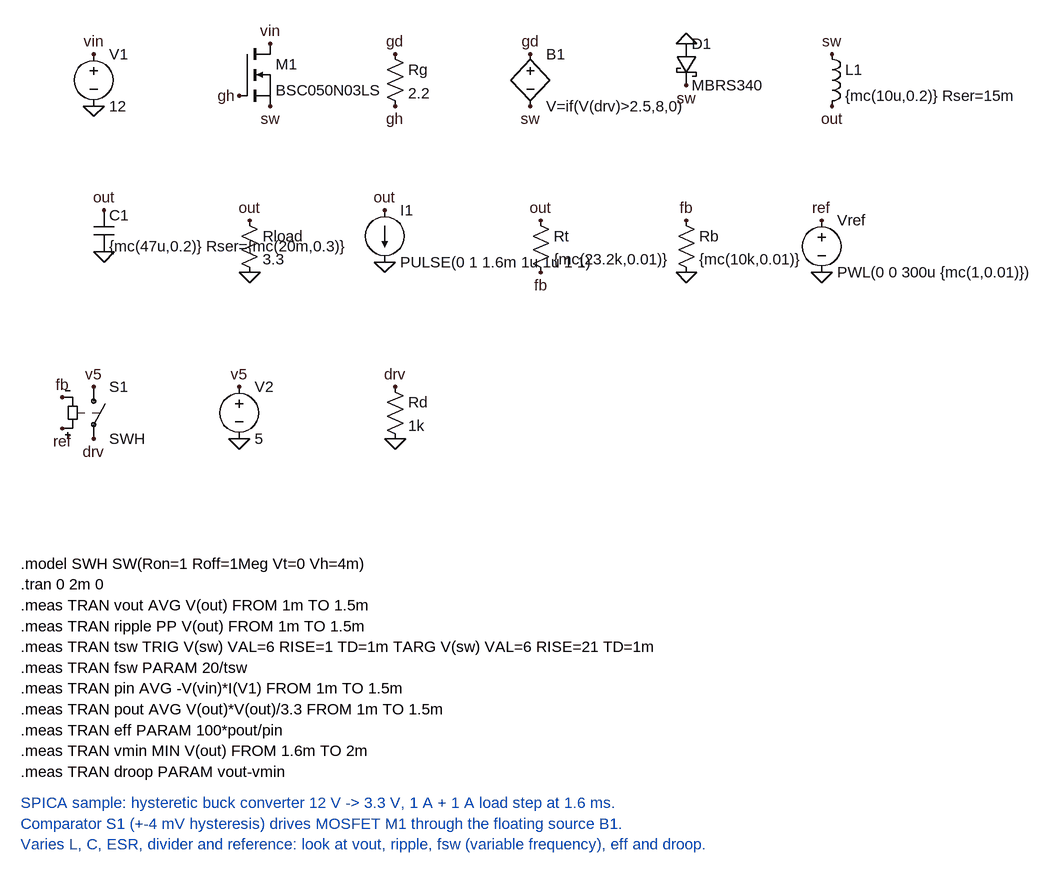
[diagram p0: schematic buck_hysteretic.asc]
buck_hysteretic.asc, the LTspice schematic file:
Version 4
SHEET 1 1600 1200
FLAG 144 80 vin
FLAG 144 160 0
FLAG 416 64 vin
FLAG 368 144 gh
FLAG 416 160 sw
FLAG 608 80 gd
FLAG 608 160 gh
FLAG 816 80 gd
FLAG 816 160 sw
FLAG 1056 64 0
FLAG 1056 128 sw
FLAG 1280 80 sw
FLAG 1280 160 out
FLAG 160 320 out
FLAG 160 384 0
FLAG 384 336 out
FLAG 384 416 0
FLAG 592 320 out
FLAG 592 400 0
FLAG 832 336 out
FLAG 832 416 fb
FLAG 1056 336 fb
FLAG 1056 416 0
FLAG 1264 336 ref
FLAG 1264 416 0
FLAG 144 592 v5
FLAG 144 672 drv
FLAG 96 656 ref
FLAG 96 608 fb
FLAG 368 592 v5
FLAG 368 672 0
FLAG 608 592 drv
FLAG 608 672 0
SYMBOL voltage 144 64 R0
SYMATTR InstName V1
SYMATTR Value 12
SYMBOL nmos 368 64 R0
SYMATTR InstName M1
SYMATTR Value BSC050N03LS
SYMBOL res 592 64 R0
SYMATTR InstName Rg
SYMATTR Value 2.2
SYMBOL bv 816 64 R0
SYMATTR InstName B1
SYMATTR Value V=if(V(drv)>2.5,8,0)
SYMBOL schottky 1040 64 R0
SYMATTR InstName D1
SYMATTR Value MBRS340
SYMBOL ind 1264 64 R0
SYMATTR InstName L1
SYMATTR Value {mc(10u,0.2)} Rser=15m
SYMBOL cap 144 320 R0
SYMATTR InstName C1
SYMATTR Value {mc(47u,0.2)} Rser={mc(20m,0.3)}
SYMBOL res 368 320 R0
SYMATTR InstName Rload
SYMATTR Value 3.3
SYMBOL current 592 320 R0
SYMATTR InstName I1
SYMATTR Value PULSE(0 1 1.6m 1u 1u 1 1)
SYMBOL res 816 320 R0
SYMATTR InstName Rt
SYMATTR Value {mc(23.2k,0.01)}
SYMBOL res 1040 320 R0
SYMATTR InstName Rb
SYMATTR Value {mc(10k,0.01)}
SYMBOL voltage 1264 320 R0
SYMATTR InstName Vref
SYMATTR Value PWL(0 0 300u {mc(1,0.01)})
SYMBOL sw 144 576 R0
SYMATTR InstName S1
SYMATTR Value SWH
SYMBOL voltage 368 576 R0
SYMATTR InstName V2
SYMATTR Value 5
SYMBOL res 592 576 R0
SYMATTR InstName Rd
SYMATTR Value 1k
TEXT 32 864 Left 2 !.model SWH SW(Ron=1 Roff=1Meg Vt=0 Vh=4m)
TEXT 32 896 Left 2 !.tran 0 2m 0
TEXT 32 928 Left 2 !.meas TRAN vout AVG V(out) FROM 1m TO 1.5m
TEXT 32 960 Left 2 !.meas TRAN ripple PP V(out) FROM 1m TO 1.5m
TEXT 32 992 Left 2 !.meas TRAN tsw TRIG V(sw) VAL=6 RISE=1 TD=1m TARG V(sw) VAL=6 RISE=21 TD=1m
TEXT 32 1024 Left 2 !.meas TRAN fsw PARAM 20/tsw
TEXT 32 1056 Left 2 !.meas TRAN pin AVG -V(vin)*I(V1) FROM 1m TO 1.5m
TEXT 32 1088 Left 2 !.meas TRAN pout AVG V(out)*V(out)/3.3 FROM 1m TO 1.5m
TEXT 32 1120 Left 2 !.meas TRAN eff PARAM 100*pout/pin
TEXT 32 1152 Left 2 !.meas TRAN vmin MIN V(out) FROM 1.6m TO 2m
TEXT 32 1184 Left 2 !.meas TRAN droop PARAM vout-vmin
TEXT 32 1232 Left 2 ;SPICA sample: hysteretic buck converter 12 V -> 3.3 V, 1 A + 1 A load step at 1.6 ms.
TEXT 32 1264 Left 2 ;Comparator S1 (+-4 mV hysteresis) drives MOSFET M1 through the floating source B1.
TEXT 32 1296 Left 2 ;Varies L, C, ESR, divider and reference: look at vout, ripple, fsw (variable frequency), eff and droop.

The netlist it stands for:
* buck_hysteretic.asc
V1 vin 0 12
M1 vin gh sw sw BSC050N03LS
Rg gd gh 2.2
B1 gd sw V=if(V(drv)>2.5,8,0)
D1 0 sw MBRS340
L1 sw out {mc(10u,0.2)} Rser=15m
C1 out 0 {mc(47u,0.2)} Rser={mc(20m,0.3)}
Rload out 0 3.3
I1 out 0 PULSE(0 1 1.6m 1u 1u 1 1)
Rt out fb {mc(23.2k,0.01)}
Rb fb 0 {mc(10k,0.01)}
Vref ref 0 PWL(0 0 300u {mc(1,0.01)})
S1 v5 drv ref fb SWH
V2 v5 0 5
Rd drv 0 1k
.model D D
.lib standard.dio
.model NMOS NMOS
.model PMOS PMOS
.lib standard.mos
.model SWH SW(Ron=1 Roff=1Meg Vt=0 Vh=4m)
.tran 0 2m 0
.meas TRAN vout AVG V(out) FROM 1m TO 1.5m
.meas TRAN ripple PP V(out) FROM 1m TO 1.5m
.meas TRAN tsw TRIG V(sw) VAL=6 RISE=1 TD=1m TARG V(sw) VAL=6 RISE=21 TD=1m
.meas TRAN fsw PARAM 20/tsw
.meas TRAN pin AVG -V(vin)*I(V1) FROM 1m TO 1.5m
.meas TRAN pout AVG V(out)*V(out)/3.3 FROM 1m TO 1.5m
.meas TRAN eff PARAM 100*pout/pin
.meas TRAN vmin MIN V(out) FROM 1.6m TO 2m
.meas TRAN droop PARAM vout-vmin
* SPICA sample: hysteretic buck converter 12 V -> 3.3 V, 1 A + 1 A load step at 1.6 ms.
* Comparator S1 (+-4 mV hysteresis) drives MOSFET M1 through the floating source B1.
* Varies L, C, ESR, divider and reference: look at vout, ripple, fsw (variable frequency), eff and droop.
.backanno
.end